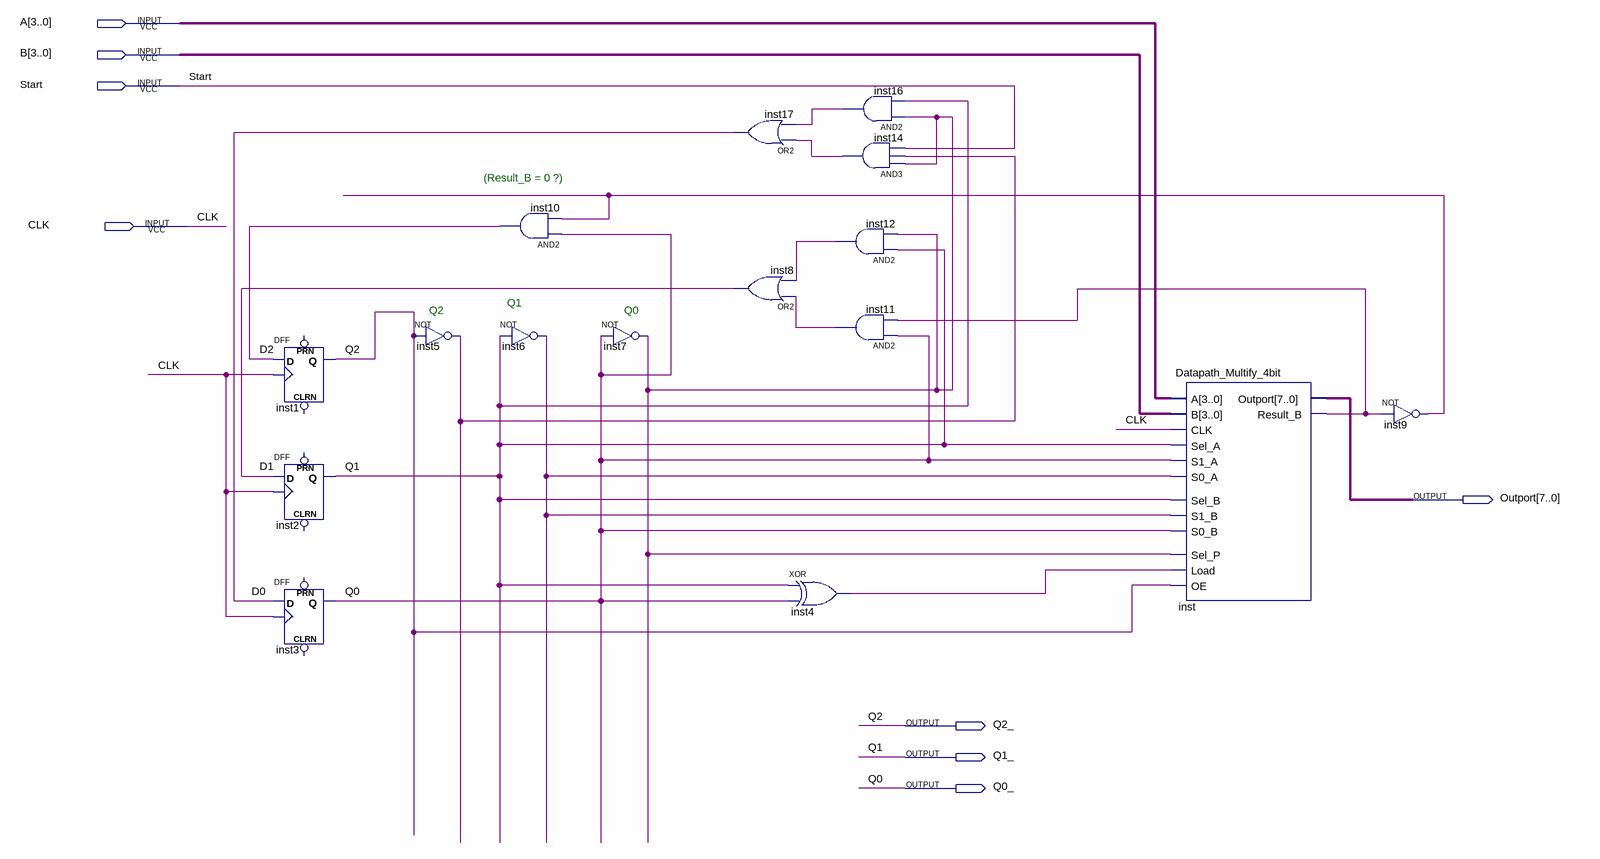
[diagram p0: schematic sheet]
// Quartus schematic cau01.bdf as structural Verilog: 16 symbols, 8 pins
module cau01 (
  input  [3:0] A,
  input  [3:0] B,
  input  Start,
  input  CLK,
  output [7:0] Outport,
  output Q2_,
  output Q1_,
  output Q0_
);

  wire D0, D1, D2, inst4_out, inst5_out, inst6_out, inst7_out, inst9_out, inst11_out, inst12_out, inst14_out,
       inst16_out, inst_result_b;

  DFF inst1 (.CLK(CLK), .D(D2), .Q(Q2_));  // open: CLRN, PRN
  DFF inst2 (.CLK(CLK), .D(D1), .Q(Q1_));  // open: CLRN, PRN
  DFF inst3 (.CLK(CLK), .D(D0), .Q(Q0_));  // open: CLRN, PRN
  not inst5 (inst5_out, Q2_);
  and inst10 (D2, Q0_, inst9_out);
  not inst6 (inst6_out, Q1_);
  not inst7 (inst7_out, Q0_);
  or inst17 (D0, inst14_out, inst16_out);
  or inst8 (D1, inst11_out, inst12_out);
  xor inst4 (inst4_out, Q1_, Q0_);
  and inst16 (inst16_out, inst7_out, Q1_);
  and inst14 (inst14_out, inst7_out, inst5_out, Start);
  and inst12 (inst12_out, Q1_, inst7_out);
  and inst11 (inst11_out, Q0_, inst_result_b);
  Datapath_Multify_4bit inst (
    .A(A), .CLK(CLK), .Sel_A(Q1_), .S1_A(Q0_), .S0_A(inst6_out), .Sel_B(Q1_), .S1_B(inst6_out), .S0_B(Q0_),
    .Sel_P(inst7_out), .Load(inst4_out), .OE(Q2_), .B(B), .Outport(Outport), .Result_B(inst_result_b));
  not inst9 (inst9_out, inst_result_b);

  // Other names for the same wires on the sheet: Q0 = Q0_; Q1 = Q1_; Q2 = Q2_

  // Notes on the sheet:
  //   (Result_B = 0 ?)
  //   Q1
  //   Q2
  //   Q0
endmodule
